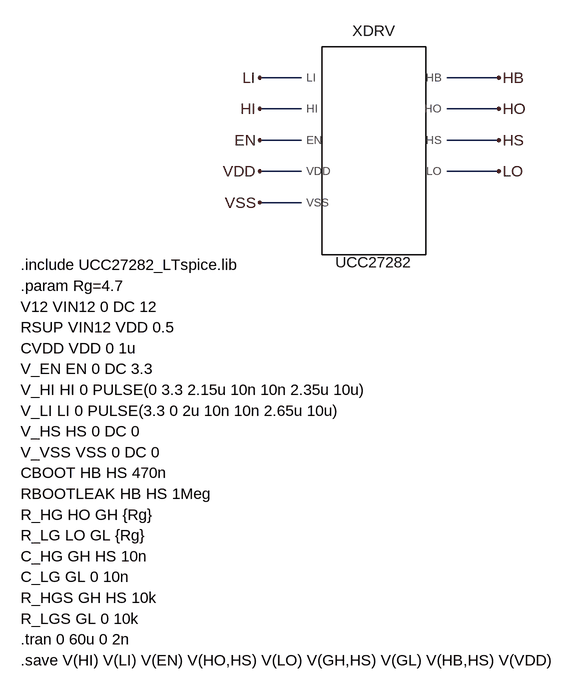
[diagram p0: schematic UCC27282_gate_test.asc]
UCC27282_gate_test.asc, the LTspice schematic file:
Version 4
SHEET 1 1600 1100
WIRE 480 256 416 256
FLAG 416 256 LI
WIRE 480 304 416 304
FLAG 416 304 HI
WIRE 480 352 416 352
FLAG 416 352 EN
WIRE 480 400 416 400
FLAG 416 400 VDD
WIRE 480 448 416 448
FLAG 416 448 VSS
WIRE 784 256 704 256
FLAG 784 256 HB
WIRE 784 304 704 304
FLAG 784 304 HO
WIRE 784 352 704 352
FLAG 784 352 HS
WIRE 784 400 704 400
FLAG 784 400 LO
SYMBOL UCC27282 512 208 R0
SYMATTR InstName XDRV
SYMATTR Value UCC27282
TEXT 48 544 Left 2 !.include UCC27282_LTspice.lib
TEXT 48 576 Left 2 !.param Rg=4.7
TEXT 48 608 Left 2 !V12 VIN12 0 DC 12
TEXT 48 640 Left 2 !RSUP VIN12 VDD 0.5
TEXT 48 672 Left 2 !CVDD VDD 0 1u
TEXT 48 704 Left 2 !V_EN EN 0 DC 3.3
TEXT 48 736 Left 2 !V_HI HI 0 PULSE(0 3.3 2.15u 10n 10n 2.35u 10u)
TEXT 48 768 Left 2 !V_LI LI 0 PULSE(3.3 0 2u 10n 10n 2.65u 10u)
TEXT 48 800 Left 2 !V_HS HS 0 DC 0
TEXT 48 832 Left 2 !V_VSS VSS 0 DC 0
TEXT 48 864 Left 2 !CBOOT HB HS 470n
TEXT 48 896 Left 2 !RBOOTLEAK HB HS 1Meg
TEXT 48 928 Left 2 !R_HG HO GH {Rg}
TEXT 48 960 Left 2 !R_LG LO GL {Rg}
TEXT 48 992 Left 2 !C_HG GH HS 10n
TEXT 48 1024 Left 2 !C_LG GL 0 10n
TEXT 48 1056 Left 2 !R_HGS GH HS 10k
TEXT 48 1088 Left 2 !R_LGS GL 0 10k
TEXT 48 1120 Left 2 !.tran 0 60u 0 2n
TEXT 48 1152 Left 2 !.save V(HI) V(LI) V(EN) V(HO,HS) V(LO) V(GH,HS) V(GL) V(HB,HS) V(VDD)

The netlist it stands for:
* UCC27282_gate_test.asc
XXDRV LI HI EN VDD VSS HB HO HS LO UCC27282  ; pins LI HI EN VDD VSS HB HO HS LO
.include UCC27282_LTspice.lib
.param Rg=4.7
V12 VIN12 0 DC 12
RSUP VIN12 VDD 0.5
CVDD VDD 0 1u
V_EN EN 0 DC 3.3
V_HI HI 0 PULSE(0 3.3 2.15u 10n 10n 2.35u 10u)
V_LI LI 0 PULSE(3.3 0 2u 10n 10n 2.65u 10u)
V_HS HS 0 DC 0
V_VSS VSS 0 DC 0
CBOOT HB HS 470n
RBOOTLEAK HB HS 1Meg
R_HG HO GH {Rg}
R_LG LO GL {Rg}
C_HG GH HS 10n
C_LG GL 0 10n
R_HGS GH HS 10k
R_LGS GL 0 10k
.tran 0 60u 0 2n
.save V(HI) V(LI) V(EN) V(HO,HS) V(LO) V(GH,HS) V(GL) V(HB,HS) V(VDD)
.backanno
.end